# Altium schematic sheet Connectors.SchDoc
size A; SheetNumber: 4; SheetTotal: 4
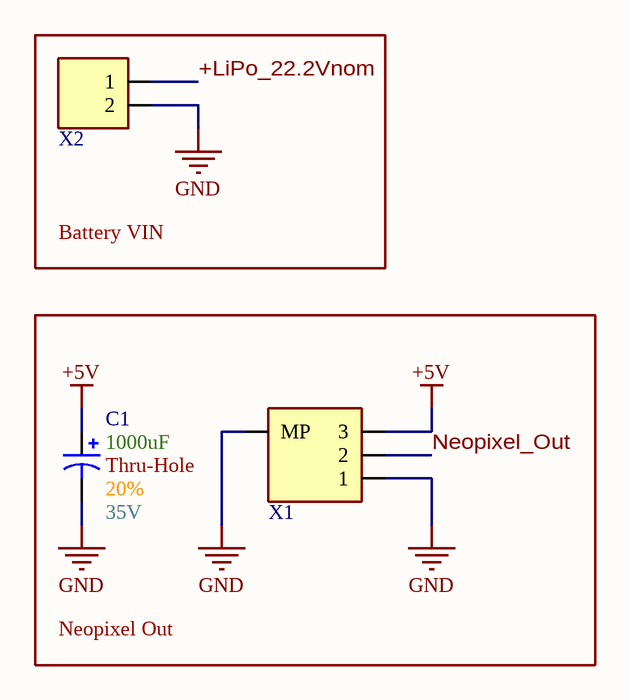
[diagram p0: Connectors.SchDoc]

## Parts
C1  Max Voltage: 35V  Size Package: Thru-Hole  Tolerance: 20%  Capacitance: 1000uF  [[Cap] Thru-Hole Polarized 10mm]  (hidden comment: [Cap] Thru-Hole 1000uF 20% 35V)
X1  [Pheonix] 3pin 2.5mm pitch  [[Pheonix] 3pin 2.5mm pitch]  (value not drawn)
X2  Anderson 2pos Right-Angle  [[Anderson] 2pos Right-Angle w/o MH 1327G17]  (value not drawn)

## Blocks framed on the sheet
Battery VIN: X2
Neopixel Out: C1 X1

## Nets
+5V: C1.1 X1.3
GND: C1.2 X1.1 X1.MP X2.2
+LiPo_22.2Vnom: X2.1
Neopixel_Out: X1.2

## Library data of the parts
C1 = [Cap] Thru-Hole 1000uF 20% 35V: 35PK1000MEFC10X20; Supplier 1: DigiKey; Supplier Part Number 1: 1189-1742-ND
X1 = [Pheonix] 3pin 2.5mm pitch: 1778777; Supplier 1: DigiKey; Supplier Part Number 1: 277-2316-1-ND
X2 = [Anderson] 2pos Right-Angle w/o MH